# Altium schematic sheet Capasitors_vac.SchDoc
size A; SheetNumber: 1; SheetTotal: 9
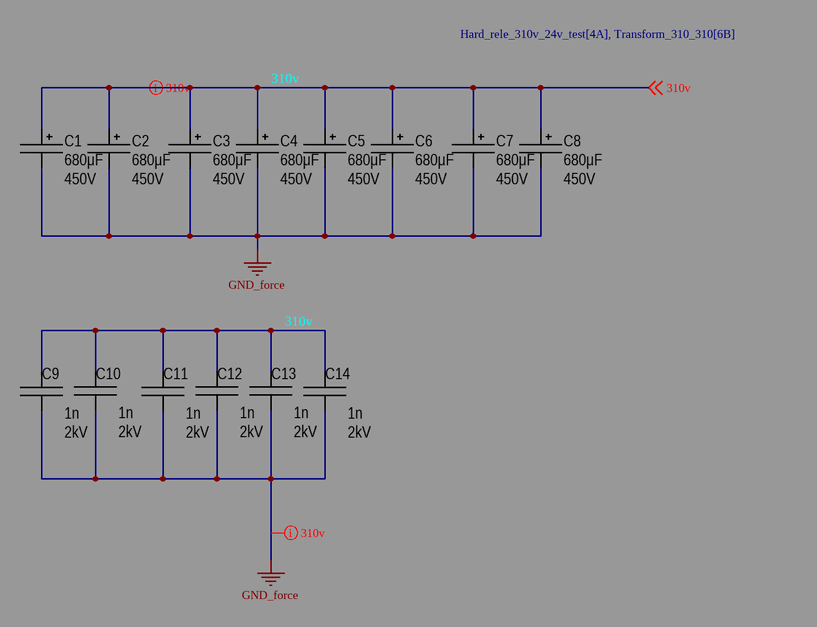
[diagram p0: Capasitors_vac.SchDoc]

## Parts
C1  value 680μF  Voltage: 450V  [CAP: D35C10H40]
C2  value 680μF  Voltage: 450V  [CAP: D35C10H40]
C3  value 680μF  Voltage: 450V  [CAP: D35C10H40]
C4  value 680μF  Voltage: 450V  [CAP: D35C10H40]
C5  value 680μF  Voltage: 450V  [CAP: D35C10H40]
C6  value 680μF  Voltage: 450V  [CAP: D35C10H40]
C7  value 680μF  Voltage: 450V  [CAP: D35C10H40]
C8  value 680μF  Voltage: 450V  [CAP: D35C10H40]
C9  value 1n  Voltage: 2kV  [CAP: AY2102M29Y5US63L7]
C10  value 1n  Voltage: 2kV  [CAP: AY2102M29Y5US63L7]
C11  value 1n  Voltage: 2kV  [CAP: AY2102M29Y5US63L7]
C12  value 1n  Voltage: 2kV  [CAP: AY2102M29Y5US63L7]
C13  value 1n  Voltage: 2kV  [CAP: AY2102M29Y5US63L7]
C14  value 1n  Voltage: 2kV  [CAP: AY2102M29Y5US63L7]

## Nets
GND_force: C1.2 C2.2 C3.2 C4.2 C5.2 C6.2 C7.2 C8.2 C9.2 C10.2 C11.2 C12.2 C13.2 C14.2
310v: C1.1 C2.1 C3.1 C4.1 C5.1 C6.1 C7.1 C8.1 C9.1 C10.1 C11.1 C12.1 C13.1 C14.1 ; off-sheet 310v

## Layout directives
net class 310v: 310v, GND_force

## Library data of the parts
C1-C8 = Aluminium: Manufacturer: Wurth; PartNumber: 860080475013; ValueManufacturerPartNumber: Aluminium capacitor, 680μF, 450V, ±20%, 54mOhm, 14x10x5 mm, -55...+105°C; TypeCapacitor: Aluminium capacitor; Tolerance: ±20%; Impedance: 54mOhm; Package: 14x10x5 mm; HelpURL: https://www.digikey.com/product-detail/en/wurth-electronics-inc/860080475013/732-9029-1-ND/5728972; Temperature: -55...+105°C
C9-C14 = Film: Manufacturer: Epcos; PartNumber: B32774D4106K000; ValueManufacturerPartNumber: Film capacitor, 1n, 2kV, ±10%, 10.9mOhm, 31.5x15 mm, -40...+105°C; TypeCapacitor: Film capacitor; Tolerance: ±10%; Impedance: 10.9mOhm; Package: 31.5x15 mm; HelpURL: https://www.digikey.com/products/en/capacitors/film-capacitors/62?k=&pkeyword=&sv=0&pv2097=1958&sf=0&FV=fffc01ef%2C1f140000%2Cffe0003e%2Cffec6366&quantity=1&ColumnSort=1000011&page=1&stock=1&pageSize=25; Temperature: -40...+105°C